# Altium schematic sheet Power-Sheet-1.SchDoc (part 2 of 3)
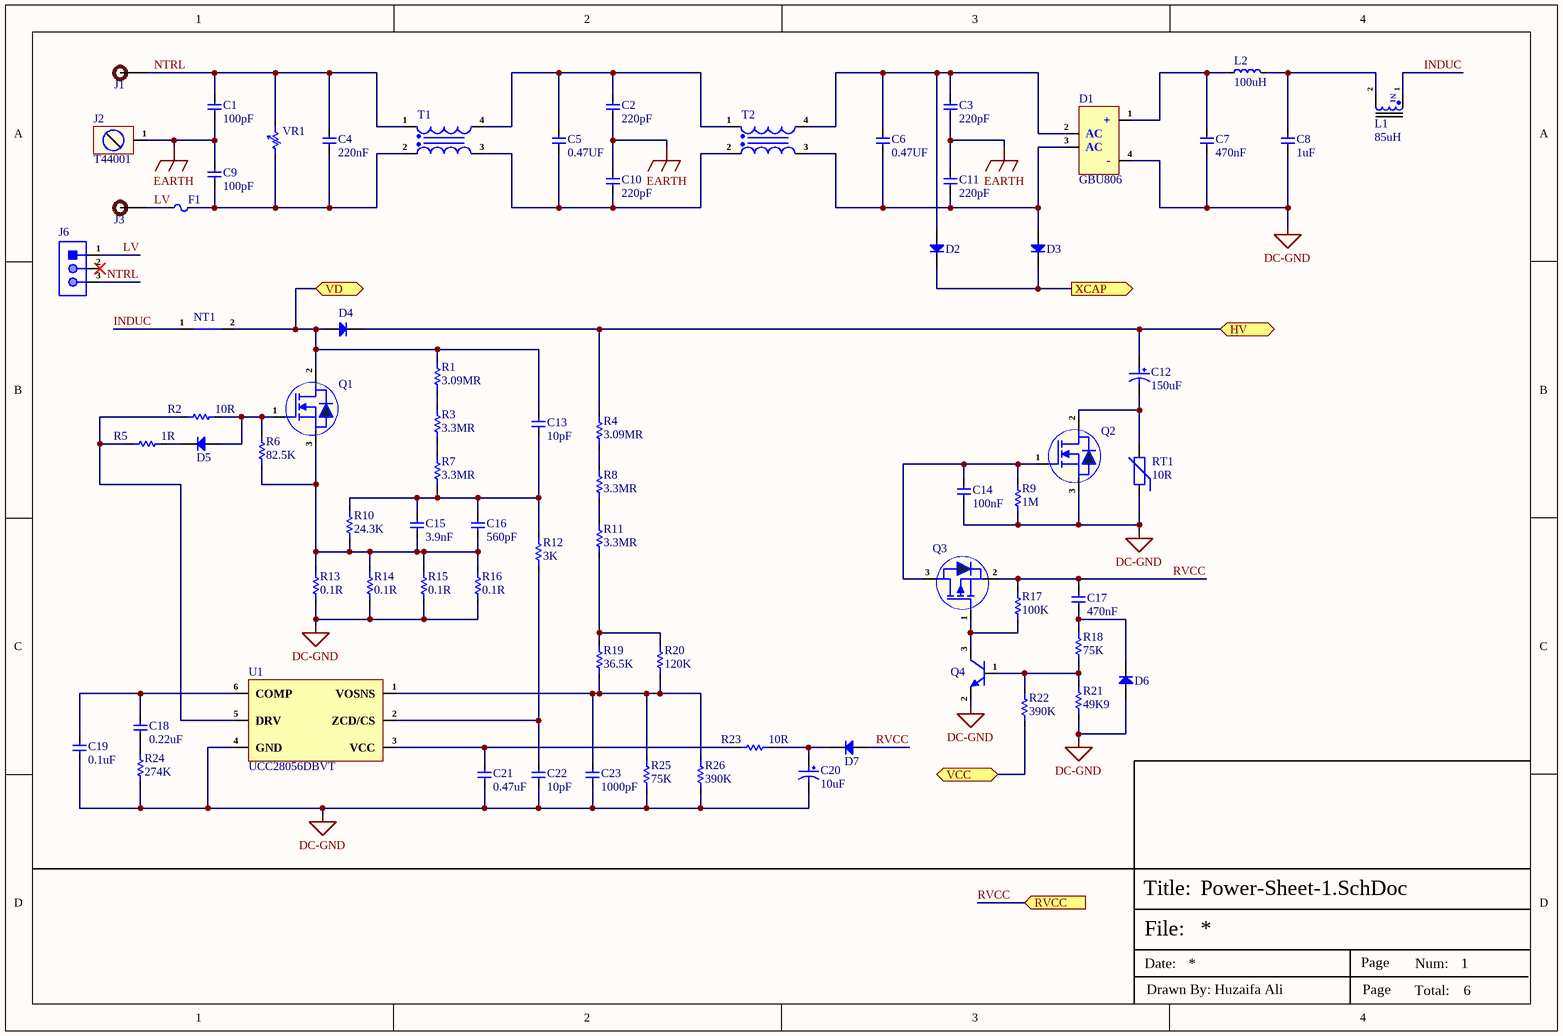
[diagram p1: Power-Sheet-1.SchDoc]
## Library data of the parts
C1 C9 = DE1B3RA101KN4AN01F: CAP CER 100PF 250V RADIAL; Manufacturer: Murata; Item Type: Capacitors; Material: 4241ConductorMaterial; Supplier: Mouser; LCSC Part Number: C3285641; Manufacturer Part Number: DE1B3RA101KN4AN01F; RoHS: Yes; Stock: 583; Pricing: 1=0.3, 10=0.147, 50=0.147, 100=0.123, 1000=0.089, 10000=0.061 (USD); Height: 9mm; ComponentLink1URL: https://search.murata.co.jp/Ceramy/image/img/A01X/G101/ENG/DE1_RA_N01F_E.pdf?src-supplier=Digikey; ComponentLink1Description: https://search.murata.co.jp/Ceramy/image/img/A01X/G101/ENG/DE1_RA_N01F_E.pdf?src-supplier=Digikey
C2 C3 C10 C11 = DE1B3RA221KN4AN01F: CAP CER 220PF 250V RADIAL; Manufacturer: Murata; Item Type: Suppression Capacitor; Supplier: Mouser; LCSC Part Number: C1622503; Manufacturer Part Number: DE1B3RA221KN4AN01F; RoHS: Yes; Stock: 985; Pricing: 1=0.35, 10=0.168, 50=0.168, 100=0.141, 1000=0.107, 10000=0.069 (USD); ComponentLink1URL: https://search.murata.co.jp/Ceramy/image/img/A01X/G101/ENG/DE1_RA_N01F_E.pdf?src-supplier=Digikey; ComponentLink1Description: https://search.murata.co.jp/Ceramy/image/img/A01X/G101/ENG/DE1_RA_N01F_E.pdf?src-supplier=Digikey
C4 = X2P2224KN1B0130150080ES0: 220nF ±10% X2 275V Plugin,P=10mm Suppression Capacitors ROHS; Manufacturer: STE; Manufacturer Part Number: X2P2224KN1B0130150080ES0; Package: Plugin,P=10mm; LCSC Part Number: C286022; Item Type: Suppression Capacitor; ComponentLink1Description: LCSC; ComponentLink1URL: https://www.lcsc.com/product-detail/Suppression-Capacitors_STE-Songtian-Elec-X2P2224KN1B0130150080ES0_C286022.html
C5 C6 = R46KI347050M1K: CAP FILM 0.47UF 10% 560VDC RAD; Manufacturer: KEMET; Item Type: Capacitor; Lead Length: 25mm; Supplier: Mouser; LCSC Part Number: C696791; Manufacturer Part Number: R46KI347050M1K; RoHS: Yes; Stock: 2256; Pricing: 1=0.88, 10=0.633, 50=0.633, 100=0.493, 1000=0.421, 10000=0.322 (USD); Pins: 2NUMBER; ComponentLink1URL: http://components.arrow.com/part/dataview/47471301S8592209N7429?src-supplier=Arrow+Electronics; ComponentLink1Description: http://components.arrow.com/part/dataview/47471301S8592209N7429?src-supplier=Arrow+Electronics; ComponentLink2URL: http://datasheet.octopart.com/R46KI347050M1K-Kemet-datasheet-5313608.pdf?src-supplier=Mouser; ComponentLink2Description: http://datasheet.octopart.com/R46KI347050M1K-Kemet-datasheet-5313608.pdf?src-supplier=Mouser; ComponentLink3URL: https://datasheet.octopart.com/R46KI347050M1K-Kemet-datasheet-5313608.pdf?src-supplier=Element14; ComponentLink3Description: https://datasheet.octopart.com/R46KI347050M1K-Kemet-datasheet-5313608.pdf?src-supplier=Element14; ComponentLink4URL: http://datasheet.octopart.com/R46KI347050M1K-Kemet-datasheet-5313608.pdf?src-supplier=Newark; ComponentLink4Description: http://datasheet.octopart.com/R46KI347050M1K-Kemet-datasheet-5313608.pdf?src-supplier=Newark; ComponentLink5URL: http://datasheet.octopart.com/R46KI347050M1K-Kemet-datasheet-5313608.pdf?src-supplier=Distrelec; ComponentLink5Description: http://datasheet.octopart.com/R46KI347050M1K-Kemet-datasheet-5313608.pdf?src-supplier=Distrelec; ComponentLink6URL: https://api.kemet.com/component-edge/download/datasheet/R46KI347050M1K.pdf?src-supplier=Digikey; ComponentLink6Description: https://api.kemet.com/component-edge/download/datasheet/R46KI347050M1K.pdf?src-supplier=Digikey; ComponentLink7URL: http://datasheet.octopart.com/R46KI347050M1K-Kemet-datasheet-5313608.pdf?src-supplier=Avnet; ComponentLink7Description: http://datasheet.octopart.com/R46KI347050M1K-Kemet-datasheet-5313608.pdf?src-supplier=Avnet; ComponentLink8URL: http://datasheet.octopart.com/R46KI347050M1K-Kemet-datasheet-5313608.pdf?src-supplier=Farnell; ComponentLink8Description: http://datasheet.octopart.com/R46KI347050M1K-Kemet-datasheet-5313608.pdf?src-supplier=Farnell; ComponentLink9URL: http://datasheet.octopart.com/R46KI347050M1K-Kemet-datasheet-5313608.pdf?src-supplier=Arrow+Electronics; ComponentLink9Description: http://datasheet.octopart.com/R46KI347050M1K-Kemet-datasheet-5313608.pdf?src-supplier=Arrow+Electronics; ComponentLink10URL: http://datasheet.octopart.com/R46KI347050M1K-Kemet-datasheet-5313608.pdf?src-supplier=Onlinecomponents.com; ComponentLink10Description: http://datasheet.octopart.com/R46KI347050M1K-Kemet-datasheet-5313608.pdf?src-supplier=Onlinecomponents.com; ComponentLink11URL: http://datasheet.octopart.com/R46KI347050M1K-Kemet-datasheet-5313608.pdf?src-supplier=Verical; ComponentLink11Description: http://datasheet.octopart.com/R46KI347050M1K-Kemet-datasheet-5313608.pdf?src-supplier=Verical; ComponentLink12URL: http://datasheet.octopart.com/R46KI347050M1K-Kemet-datasheet-5313608.pdf?src-supplier=LCSC; ComponentLink12Description: http://datasheet.octopart.com/R46KI347050M1K-Kemet-datasheet-5313608.pdf?src-supplier=LCSC; ComponentLink13URL: https://datasheet.octopart.com/R46KI347050M1K-Kemet-datasheet-67199277.pdf?src-supplier=TME; ComponentLink13Description: https://datasheet.octopart.com/R46KI347050M1K-Kemet-datasheet-67199277.pdf?src-supplier=TME; ComponentLink14URL: http://datasheet.octopart.com/R46KI347050M1K-Kemet-datasheet-5313608.pdf?src-supplier=Electro+Sonic; ComponentLink14Description: http://datasheet.octopart.com/R46KI347050M1K-Kemet-datasheet-5313608.pdf?src-supplier=Electro+Sonic
C7 = 450MPK474J: CAP FILM 0.47UF 5% 450VDC RADIAL; Manufacturer: Rubycon; Item Type: Film Capacitors; Dielectric Material: Polypropylene; Voltage Rating (DC): 450V; Supplier: Digikey; LCSC Part Number: C2798220; Manufacturer Part Number: 450MPK474J; RoHS: Yes; Stock: 4083; Pricing: 1=0.84, 10=0.605, 100=0.4311, 4000=0.26942, 8000=0.25962, 12000=0.25531 (USD); Mounting Technology: Through Hole; Case/Package: Radial; Min Operating Temperature: -40°C; Max Operating Temperature: 105°C; Package Quantity: 1; Value: 470nF; Tolerance: 5%; Packaging: Cut Tape; Termination: PC Pins; Series: MPK; Length: 0.709inch; Width: 0.256inch; Height - Seated (Max): 0.433inch; Lead Pitch: 0.591inch; RoHS Compliant: Yes; ComponentLink1URL: https://datasheet.ciiva.com/6281/e-mpk-6281321.pdf?src-supplier=Digikey; ComponentLink1Description: https://datasheet.ciiva.com/6281/e-mpk-6281321.pdf?src-supplier=Digikey; ComponentLink2URL: https://datasheet.ciiva.com/15021/e-mpk-15021932.pdf?src-supplier=Digikey; ComponentLink2Description: https://datasheet.ciiva.com/15021/e-mpk-15021932.pdf?src-supplier=Digikey
C8 = MPP105J2W10KN22605: 1uF -40℃~+105℃ ±5% 450V Plugin,P=10mm Polypropylene Film Capacitors (CBB) ROHS; Manufacturer: KNSCHA; Supplier: LCSC; LCSC Part Number: C2686214; Manufacturer Part Number: MPP105J2W10KN22605; RoHS: No; Item Type: Capacitor
C12 = KN151M45025*30A: 20% 900mA@120Hz 10mm 450V 150uF Plugin,D25xL30mm Horn-Type Electrolytic Capacitors ROHS; Manufacturer: KFSON; Manufacturer Part Number: KN151M45025*30A; Package: Plugin,D25xL30mm; LCSC Part Number: C513373; Item Type: Capacitor; ComponentLink1Description: LCSC; ComponentLink1URL: https://www.lcsc.com/product-detail/Horn-Type-Electrolytic-Capacitors_KFSON-KN151M45025-30A_C513373.html
C13 = CC1206JKNPOCBN100: CAP CER 10PF 1KV C0G/NPO 1206; Manufacturer: Yageo; Item Type: Capacitor; Supplier: Future Electronics; LCSC Part Number: C107172; Manufacturer Part Number: CC1206JKNPOCBN100; RoHS: Yes; Stock: 9000; Pricing: 3000=0.0222, 9000=0.0214, 15000=0.021, 60000=0.0201, 90000=0.0194 (USD); ComponentLink1URL: https://datasheet.ciiva.com/11494/hv-11494856.pdf?src-supplier=Avnet; ComponentLink1Description: https://datasheet.ciiva.com/11494/hv-11494856.pdf?src-supplier=Avnet
C14 = CC0603KRX5R9BB104: CAP CER 0.1UF 50V X5R 0603; Manufacturer: Yageo; Tolerance: 10%; Item Type: Capacitor; Supplier 1: Digi-Key; Manufacturer Part Number: CC0603KRX5R9BB104; RoHS: Yes; Category: Ceramic Capacitors; Stock 1: 152253; Pricing 1: 1=0.10000, 10=0.05200, 50=0.02820, 100=0.02310, 500=0.01648, 1000=0.01294 (USD); Mount: Surface Mount; Case/Package: 0603; Case Code (Imperial): 0603; Case Code (Metric): 1608; Weight: 7.1E-05oz; Min Operating Temperature: -55°C; Max Operating Temperature: 85°C; Capacitance: 100nF; Packaging: Tape and Reel; Voltage Rating: 50V; Dielectric: X5R; Termination: SMD/SMT; Voltage Rating (DC): 50V; Package Quantity: 4000; Length: 0.063inch; Width: 0.031inch; Thickness: 0.035inch; Lead Free: Lead Free; Halogen Free: Halogen Free; ComponentLink1URL: http://www.mouser.com/ds/2/447/Yageo_UPY-GP_NP0_16V-to-50V_9-358835.pdf?src-supplier=Mouser; ComponentLink1Description: http://www.mouser.com/ds/2/447/Yageo_UPY-GP_NP0_16V-to-50V_9-358835.pdf?src-supplier=Mouser; ComponentLink2URL: https://www.yageo.com/upload/media/product/productsearch/datasheet/mlcc/UPY-GPHC_X5R_4V-to-50V_26.pdf?src-supplier=Digi-Key; ComponentLink2Description: https://www.yageo.com/upload/media/product/productsearch/datasheet/mlcc/UPY-GPHC_X5R_4V-to-50V_26.pdf?src-supplier=Digi-Key; ComponentLink3URL: http://www.yageo.com/exep/pages/download/literatures/ProductSelectionGuide%202014_Final_2.pdf?src-supplier=Digi-Key; ComponentLink3Description: http://www.yageo.com/exep/pages/download/literatures/ProductSelectionGuide%202014_Final_2.pdf?src-supplier=Digi-Key; Supplier Part Number 1: 311-4046-1-ND; LCSC Part Number: C110022
C15 = CC0603KRX7R8BB392: CAP CER 3900PF 25V X7R 0603; Manufacturer: Yageo; Item Type: Capacitor; Material: 4241ConductorMaterial; Tolerance: 10%; Supplier: Digikey; LCSC Part Number: C519424; Manufacturer Part Number: CC0603KRX7R8BB392; RoHS: Yes; Stock: 46115; Pricing: 1=0.1, 10=0.061, 50=0.035, 100=0.0271, 500=0.02036, 1000=0.016 (USD); Mounting Technology: Surface Mount; Case/Package: 0603; Case Code (Imperial): 0603; Case Code (Metric): 1608; Weight: 7.1E-05oz; Min Operating Temperature: -55°C; Max Operating Temperature: 125°C; Value: 3.9nF; Voltage Rating (DC): 25V; Packaging: Tape and Reel; Dielectric: X7R; Termination: SMD/SMT; Voltage Rating: 25V; Series: CC; Length: 0.063inch; Width: 0.031inch; Height: 900um; Thickness: 0.035inch; Lead Free: Lead Free; Halogen Free: Halogen Free; ComponentLink1URL: https://datasheet.ciiva.com/13207/upy-gphc-x7r-6-3v-to-50v-8-12304-13207771.pdf?src-supplier=Mouser; ComponentLink1Description: https://datasheet.ciiva.com/13207/upy-gphc-x7r-6-3v-to-50v-8-12304-13207771.pdf?src-supplier=Mouser
C16 = 06035A561JAT2A: CAP CER 560PF 50V C0G/NP0 0603; Manufacturer: Kyocera AVX; Item Type: Capacitor; Supplier: Future Electronics; LCSC Part Number: C597173; Manufacturer Part Number: 06035A561JAT2A; RoHS: Yes; Stock: 180000; Pricing: 4000=0.0172, 16000=0.0165, 40000=0.0091, 60000=0.0158, 100000=0.0088, 120000=0.0155, 160000=0.0083, 300000=0.0148 (USD); ComponentLink1URL: https://datasheet.ciiva.com/27051/1032160-27051276.pdf?src-supplier=Jameco; ComponentLink1Description: https://datasheet.ciiva.com/27051/1032160-27051276.pdf?src-supplier=Jameco; ComponentLink2URL: https://datasheet.ciiva.com/16286/ccog-16286446.pdf?src-supplier=Future+Electronics; ComponentLink2Description: https://datasheet.ciiva.com/16286/ccog-16286446.pdf?src-supplier=Future+Electronics; ComponentLink3URL: https://datasheet.ciiva.com/150/ccog-150647.pdf?src-supplier=Digikey; ComponentLink3Description: https://datasheet.ciiva.com/150/ccog-150647.pdf?src-supplier=Digikey; ComponentLink4URL: https://datasheet.ciiva.com/150/ccog-150648.pdf?src-supplier=Digikey; ComponentLink4Description: https://datasheet.ciiva.com/150/ccog-150648.pdf?src-supplier=Digikey; ComponentLink5URL: https://datasheet.ciiva.com/150/ccog-150649.pdf?src-supplier=Digikey; ComponentLink5Description: https://datasheet.ciiva.com/150/ccog-150649.pdf?src-supplier=Digikey; ComponentLink6URL: https://datasheet.ciiva.com/2987/ccog-2987809.pdf?src-supplier=Avnet; ComponentLink6Description: https://datasheet.ciiva.com/2987/ccog-2987809.pdf?src-supplier=Avnet; ComponentLink7URL: https://datasheet.ciiva.com/2987/ccog-2987810.pdf?src-supplier=Avnet; ComponentLink7Description: https://datasheet.ciiva.com/2987/ccog-2987810.pdf?src-supplier=Avnet; ComponentLink8URL: https://datasheet.ciiva.com/5423/ccog-5423589.pdf?src-supplier=Mouser; ComponentLink8Description: https://datasheet.ciiva.com/5423/ccog-5423589.pdf?src-supplier=Mouser; ComponentLink9URL: https://datasheet.ciiva.com/14598/70001039-14598549.pdf?src-supplier=Allied+Electronics; ComponentLink9Description: https://datasheet.ciiva.com/14598/70001039-14598549.pdf?src-supplier=Allied+Electronics; ComponentLink10URL: https://datasheet.ciiva.com/1124/425357-1124836.pdf?src-supplier=Element14; ComponentLink10Description: https://datasheet.ciiva.com/1124/425357-1124836.pdf?src-supplier=Element14; ComponentLink11URL: https://datasheet.ciiva.com/1124/425357-1124837.pdf?src-supplier=Element14; ComponentLink11Description: https://datasheet.ciiva.com/1124/425357-1124837.pdf?src-supplier=Element14
C17 = 12063C474KAT2A: CAP CER 0.47UF 25V X7R 1206; Manufacturer: Kyocera AVX; Item Type: Capacitor; Supplier: Future Electronics; LCSC Part Number: C5128353; Manufacturer Part Number: 12063C474KAT2A; RoHS: Yes; Stock: 38000; Pricing: 2000=0.0614, 6000=0.0591, 10000=0.0566, 20000=0.0567, 40000=0.0554, 80000=0.053 (USD); ComponentLink1URL: https://datasheet.ciiva.com/11788/0900766b80dc2409-11788602.pdf?src-supplier=Rs; ComponentLink1Description: https://datasheet.ciiva.com/11788/0900766b80dc2409-11788602.pdf?src-supplier=Rs; ComponentLink2URL: https://datasheet.ciiva.com/19476/2014158-19476160.pdf?src-supplier=Jameco; ComponentLink2Description: https://datasheet.ciiva.com/19476/2014158-19476160.pdf?src-supplier=Jameco; ComponentLink3URL: https://datasheet.ciiva.com/14601/70001075-14601957.pdf?src-supplier=Allied+Electronics; ComponentLink3Description: https://datasheet.ciiva.com/14601/70001075-14601957.pdf?src-supplier=Allied+Electronics; ComponentLink4URL: https://datasheet.ciiva.com/28546/683218-28546839.pdf?src-supplier=Element14; ComponentLink4Description: https://datasheet.ciiva.com/28546/683218-28546839.pdf?src-supplier=Element14; ComponentLink5URL: https://datasheet.ciiva.com/7833/84526-7833365.pdf?src-supplier=Element14; ComponentLink5Description: https://datasheet.ciiva.com/7833/84526-7833365.pdf?src-supplier=Element14; ComponentLink6URL: https://datasheet.ciiva.com/16291/cx7r-16291039.pdf?src-supplier=Future+Electronics; ComponentLink6Description: https://datasheet.ciiva.com/16291/cx7r-16291039.pdf?src-supplier=Future+Electronics; ComponentLink7URL: https://datasheet.ciiva.com/152/cx7r-152592.pdf?src-supplier=Digikey; ComponentLink7Description: https://datasheet.ciiva.com/152/cx7r-152592.pdf?src-supplier=Digikey; ComponentLink8URL: https://datasheet.ciiva.com/152/cx7r-152593.pdf?src-supplier=Digikey; ComponentLink8Description: https://datasheet.ciiva.com/152/cx7r-152593.pdf?src-supplier=Digikey; ComponentLink9URL: https://datasheet.ciiva.com/152/cx7r-152594.pdf?src-supplier=Digikey; ComponentLink9Description: https://datasheet.ciiva.com/152/cx7r-152594.pdf?src-supplier=Digikey
C18 = CC0603KRX7R7BB224: CAP CER 0.22UF 16V X7R 0603; Manufacturer: Yageo; Item Type: Capacitor; Material: 4241ConductorMaterial; Supplier: Digikey; Supplier Part Number: 311-1426-1-ND; Manufacturer Part Number: CC0603KRX7R7BB224; RoHS: Yes; Stock: 45192; Pricing: 1=0.1, 10=0.058, 50=0.0334, 100=0.0258, 500=0.01944, 1000=0.01528 (USD); Voltage Rating (DC): 16V; Lead Free: 5697LeadFree; Halogen Free: 5694HalogenFree; ComponentLink1URL: https://datasheet.ciiva.com/11788/0900766b80d84f1d-11788400.pdf?src-supplier=Rs; ComponentLink1Description: https://datasheet.ciiva.com/11788/0900766b80d84f1d-11788400.pdf?src-supplier=Rs; ComponentLink2URL: https://datasheet.ciiva.com/176/mlccorderingcode-176606.pdf?src-supplier=Digikey; ComponentLink2Description: https://datasheet.ciiva.com/176/mlccorderingcode-176606.pdf?src-supplier=Digikey; ComponentLink3URL: https://datasheet.ciiva.com/176/mlccorderingcode-176607.pdf?src-supplier=Digikey; ComponentLink3Description: https://datasheet.ciiva.com/176/mlccorderingcode-176607.pdf?src-supplier=Digikey; ComponentLink4URL: https://datasheet.ciiva.com/176/mlccorderingcode-176608.pdf?src-supplier=Digikey; ComponentLink4Description: https://datasheet.ciiva.com/176/mlccorderingcode-176608.pdf?src-supplier=Digikey
C19 = CL10B104KB8NNNL: CAP CER 0.1UF 50V X7R 0603; Manufacturer: Samsung; Capacitance: 100nF; Tolerance: 10%; Item Type: Capacitor; Supplier 1: Digi-Key; Manufacturer Part Number: CL10B104KB8NNNL; Stock 1: 3731229; Pricing 1: 1=0.1, 10=0.03, 50=0.0164, 100=0.0134, 500=0.00958, 1000=0.00753, 2500=0.00684, 5000=0.0063 (USD); Mount: Surface Mount; Case/Package: 0603; Min Operating Temperature: -55°C; Max Operating Temperature: 125°C; Dielectric: X7R; Packaging: Tape and Reel; Package Quantity: 15000; Voltage Rating: 50V; Voltage Rating (DC): 50V; Series: CL; Construction: Flat; Length: 1.6mm; Width: 0.031inch; Height: 0.8mm; Thickness: 0.035inch; Depth: 0.8mm; Radiation Hardening: No; RoHS Compliant: Yes; ComponentLink1URL: https://www.verical.com/server-webapp/html/getDatasheet?partID=357523&src-supplier=Verical; ComponentLink1Description: https://www.verical.com/server-webapp/html/getDatasheet?partID=357523&src-supplier=Verical; ComponentLink2URL: https://media.digikey.com/pdf/Data%20Sheets/Samsung%20PDFs/CL_Series_MLCC_ds.pdf?src-supplier=Digi-Key; ComponentLink2Description: https://media.digikey.com/pdf/Data%20Sheets/Samsung%20PDFs/CL_Series_MLCC_ds.pdf?src-supplier=Digi-Key; Supplier Part Number 1: 1276-CL10B104KB8NNNLCT-ND; LCSC Part Number: C913912
C20 = ERM1HM100D11OT: 10uF 50V ±20% 90mA@100kHz Plugin,D5xL11mm Aluminum Electrolytic Capacitors - Leaded ROHS; Manufacturer: AISHI; Supplier: Future Electronics; LCSC Part Number: C106599; Manufacturer Part Number: ERM1HM100D11OT; RoHS: No; Pricing: 1000=0.0178, 4000=0.017, 15000=0.0163, 40000=0.0158, 100000=0.015 (USD); Item Type: Capacitor
C21 = CC1206KKX7R9BB474: CAP CER 0.47UF 50V X7R 1206; Manufacturer: Yageo; Item Type: Capacitor; Material: 4241ConductorMaterial; Supplier: Future Electronics; LCSC Part Number: C277483; Manufacturer Part Number: CC1206KKX7R9BB474; RoHS: Yes; Stock: 36000; Pricing: 3000=0.0393, 9000=0.0378, 15000=0.0371, 30000=0.0362, 60000=0.0349 (USD); ComponentLink1URL: https://datasheet.ciiva.com/13210/upy-gp-np0-16v-to-50v-8-13210236.pdf?src-supplier=Mouser; ComponentLink1Description: https://datasheet.ciiva.com/13210/upy-gp-np0-16v-to-50v-8-13210236.pdf?src-supplier=Mouser; ComponentLink2URL: https://datasheet.ciiva.com/181/mlccorderingcode-181013.pdf?src-supplier=Digikey; ComponentLink2Description: https://datasheet.ciiva.com/181/mlccorderingcode-181013.pdf?src-supplier=Digikey; ComponentLink3URL: https://datasheet.ciiva.com/181/mlccorderingcode-181014.pdf?src-supplier=Digikey; ComponentLink3Description: https://datasheet.ciiva.com/181/mlccorderingcode-181014.pdf?src-supplier=Digikey; ComponentLink4URL: https://datasheet.ciiva.com/181/mlccorderingcode-181015.pdf?src-supplier=Digikey; ComponentLink4Description: https://datasheet.ciiva.com/181/mlccorderingcode-181015.pdf?src-supplier=Digikey
C22 = C0603C100K5RACAUTO: CAP CER 10PF 50V X7R 0603; Manufacturer: KEMET; Item Type: Capacitor; Material: 4241ConductorMaterial; Temperature Coefficient: 30ppm/°C; Supplier: Mouser; LCSC Part Number: C2170082; Manufacturer Part Number: C0603C100K5RACAUTO; RoHS: Yes; Stock: 11331; Pricing: 1=0.25, 10=0.116, 50=0.116, 100=0.07, 1000=0.061, 10000=0.047 (USD); Height: 870um; ComponentLink1URL: http://www.farnell.com/datasheets/2750555.pdf?src-supplier=Farnell; ComponentLink1Description: http://www.farnell.com/datasheets/2750555.pdf?src-supplier=Farnell; ComponentLink2URL: https://api.kemet.com/component-edge/download/datasheet/C0603C100K5RACAUTO.pdf?src-supplier=Digikey; ComponentLink2Description: https://api.kemet.com/component-edge/download/datasheet/C0603C100K5RACAUTO.pdf?src-supplier=Digikey; ComponentLink3URL: http://www.farnell.com/datasheets/2750555.pdf?src-supplier=Element14; ComponentLink3Description: http://www.farnell.com/datasheets/2750555.pdf?src-supplier=Element14; ComponentLink4URL: https://datasheet.octopart.com/C0603C100K5RACAUTO-KEMET-datasheet-86780146.pdf?src-supplier=Newark; ComponentLink4Description: https://datasheet.octopart.com/C0603C100K5RACAUTO-KEMET-datasheet-86780146.pdf?src-supplier=Newark; ComponentLink5URL: http://www.farnell.com/datasheets/2750555.pdf?src-supplier=Newark; ComponentLink5Description: http://www.farnell.com/datasheets/2750555.pdf?src-supplier=Newark; ComponentLink6URL: https://datasheet.octopart.com/C0603C100K5RACAUTO-KEMET-datasheet-140424581.pdf?src-supplier=TME; ComponentLink6Description: https://datasheet.octopart.com/C0603C100K5RACAUTO-KEMET-datasheet-140424581.pdf?src-supplier=TME
C23 = 06031C102KAT2A: CAP CER 1000PF 100V X7R 0603; Manufacturer: Kyocera AVX; Item Type: Capacitor; Supplier: Avnet; LCSC Part Number: C2167292; Manufacturer Part Number: 06031C102KAT2A; RoHS: Yes; Stock: 656000; Pricing: 4000=0.0086, 8000=0.0084, 16000=0.0082, 24000=0.008, 32000=0.0079 (USD); Lead Free: 5697LeadFree; ComponentLink1URL: https://datasheet.ciiva.com/5422/cx7r-218113-5422905.pdf?src-supplier=Mouser; ComponentLink1Description: https://datasheet.ciiva.com/5422/cx7r-218113-5422905.pdf?src-supplier=Mouser; ComponentLink2URL: https://datasheet.ciiva.com/11499/cx7r-11499669.pdf?src-supplier=Avnet; ComponentLink2Description: https://datasheet.ciiva.com/11499/cx7r-11499669.pdf?src-supplier=Avnet; ComponentLink3URL: https://datasheet.ciiva.com/2987/cx7r-2987733.pdf?src-supplier=Avnet; ComponentLink3Description: https://datasheet.ciiva.com/2987/cx7r-2987733.pdf?src-supplier=Avnet; ComponentLink4URL: https://datasheet.ciiva.com/150/cx7r-150395.pdf?src-supplier=Digikey; ComponentLink4Description: https://datasheet.ciiva.com/150/cx7r-150395.pdf?src-supplier=Digikey; ComponentLink5URL: https://datasheet.ciiva.com/150/cx7r-150396.pdf?src-supplier=Digikey; ComponentLink5Description: https://datasheet.ciiva.com/150/cx7r-150396.pdf?src-supplier=Digikey; ComponentLink6URL: https://datasheet.ciiva.com/150/cx7r-150397.pdf?src-supplier=Digikey; ComponentLink6Description: https://datasheet.ciiva.com/150/cx7r-150397.pdf?src-supplier=Digikey; ComponentLink7URL: https://datasheet.ciiva.com/1124/1679506-1124198.pdf?src-supplier=Element14; ComponentLink7Description: https://datasheet.ciiva.com/1124/1679506-1124198.pdf?src-supplier=Element14; ComponentLink8URL: https://datasheet.ciiva.com/22693/1679506-22693579.pdf?src-supplier=Element14; ComponentLink8Description: https://datasheet.ciiva.com/22693/1679506-22693579.pdf?src-supplier=Element14; ComponentLink9URL: https://datasheet.ciiva.com/7855/1679506-7855033.pdf?src-supplier=Element14; ComponentLink9Description: https://datasheet.ciiva.com/7855/1679506-7855033.pdf?src-supplier=Element14; ComponentLink10URL: https://datasheet.ciiva.com/7855/84526-7855189.pdf?src-supplier=Element14; ComponentLink10Description: https://datasheet.ciiva.com/7855/84526-7855189.pdf?src-supplier=Element14; ComponentLink11URL: https://datasheet.ciiva.com/16289/cx7r-16289400.pdf?src-supplier=Future+Electronics; ComponentLink11Description: https://datasheet.ciiva.com/16289/cx7r-16289400.pdf?src-supplier=Future+Electronics; ComponentLink12URL: https://datasheet.ciiva.com/14594/70001075-14594623.pdf?src-supplier=Allied+Electronics; ComponentLink12Description: https://datasheet.ciiva.com/14594/70001075-14594623.pdf?src-supplier=Allied+Electronics; ComponentLink13URL: https://datasheet.ciiva.com/14600/70001075-14600988.pdf?src-supplier=Allied+Electronics; ComponentLink13Description: https://datasheet.ciiva.com/14600/70001075-14600988.pdf?src-supplier=Allied+Electronics
D1 = GBU806: BRIDGE RECT 1PHASE 600V 8A GBU; Manufacturer: Diodes; Item Type: Diode; Supplier: Future Electronics; LCSC Part Number: C150753; Manufacturer Part Number: GBU806; RoHS: Yes; Stock: 174414; Pricing: 20=0.565, 100=0.54, 500=0.51, 1000=0.5, 3000=0.465 (USD); ComponentLink1URL: https://datasheet.ciiva.com/27052/1540404-27052400.pdf?src-supplier=Jameco; ComponentLink1Description: https://datasheet.ciiva.com/27052/1540404-27052400.pdf?src-supplier=Jameco; ComponentLink2URL: https://datasheet.ciiva.com/16206/ds21227-16206956.pdf?src-supplier=Future+Electronics; ComponentLink2Description: https://datasheet.ciiva.com/16206/ds21227-16206956.pdf?src-supplier=Future+Electronics; ComponentLink3URL: https://datasheet.ciiva.com/15145/getdatasheetpartid-157294-15145339.pdf?src-supplier=Verical; ComponentLink3Description: https://datasheet.ciiva.com/15145/getdatasheetpartid-157294-15145339.pdf?src-supplier=Verical; ComponentLink4URL: https://datasheet.ciiva.com/885/ds21227-885908.pdf?src-supplier=Digikey; ComponentLink4Description: https://datasheet.ciiva.com/885/ds21227-885908.pdf?src-supplier=Digikey; ComponentLink5URL: https://datasheet.ciiva.com/11195/ds21227-11195657.pdf?src-supplier=Avnet; ComponentLink5Description: https://datasheet.ciiva.com/11195/ds21227-11195657.pdf?src-supplier=Avnet
D2 D3 = MURA160T3G: DIODE GEN PURP 600V 1A SMA; Manufacturer: ON Semiconductor; Forward Current: 2A; Max Reverse Current: 5uA; Max Surge Current: 30A; Forward Voltage: 1.25V; Recovery Time: 75ns; Polarity: Standard; Supplier: Future Electronics; LCSC Part Number: C50432; Manufacturer Part Number: MURA160T3G; RoHS: Yes; Item Type: Diode; Stock: 190000; Pricing: 5000=0.109, 10000=0.106, 15000=0.104, 20000=0.103, 25000=0.0996 (USD); Case/Package: SMA; Pins: 2; Min Operating Temperature: -65°C; Max Operating Temperature: 175°C; Package Quantity: 1; Packaging: Tape and Reel; Average Rectified Current: 2A; Reverse Recovery Time: 75ns; Max Repetitive Reverse Voltage (Vrrm): 600V; Peak Non-Repetitive Surge Current: 30A; Max Forward Surge Current (Ifsm): 30A; Voltage Rating (DC): 600V; Current Rating: 2A; Output Current: 1A; Max Reverse Voltage (DC): 600V; Reverse Voltage: 600V; Series: -; Reverse Recovery Time-Max: 75ns; Length: 4.32mm; Width: 2.6mm; Height: 2mm; Radiation Hardening: No; Reach SVHC Compliant: No; Lead Free: Lead Free; Halogen Free: Halogen Free; RoHS Compliant: Yes; ComponentLink1URL: https://datasheet.ciiva.com/8293/mura160t3-d-8293035.pdf?src-supplier=Avnet; ComponentLink1Description: https://datasheet.ciiva.com/8293/mura160t3-d-8293035.pdf?src-supplier=Avnet; ComponentLink2URL: https://datasheet.ciiva.com/27056/2015775-27056224.pdf?src-supplier=Jameco; ComponentLink2Description: https://datasheet.ciiva.com/27056/2015775-27056224.pdf?src-supplier=Jameco; ComponentLink3URL: https://datasheet.ciiva.com/16395/mura160t3-d-16395990.pdf?src-supplier=Future+Electronics; ComponentLink3Description: https://datasheet.ciiva.com/16395/mura160t3-d-16395990.pdf?src-supplier=Future+Electronics
D4 = STTH8L06FP: DIODE GEN PURP 600V 8A TO220FPAC; Manufacturer: STMicroelectronics; Supplier: Mouser; LCSC Part Number: C77956; Manufacturer Part Number: STTH8L06FP; RoHS: Yes; Item Type: Diode; Stock: 2675; Pricing: 1=0.8, 10=0.793, 50=0.793, 100=0.793, 1000=0.673, 10000=0.377 (USD); ComponentLink1URL: https://datasheet.ciiva.com/4455/cd00002721-110256-4455363.pdf?src-supplier=Mouser; ComponentLink1Description: https://datasheet.ciiva.com/4455/cd00002721-110256-4455363.pdf?src-supplier=Mouser; ComponentLink2URL: https://datasheet.ciiva.com/7964/1522573-7964086.pdf?src-supplier=Element14; ComponentLink2Description: https://datasheet.ciiva.com/7964/1522573-7964086.pdf?src-supplier=Element14; ComponentLink3URL: https://datasheet.ciiva.com/917/cd00002721-917751.pdf?src-supplier=Digikey; ComponentLink3Description: https://datasheet.ciiva.com/917/cd00002721-917751.pdf?src-supplier=Digikey; ComponentLink4URL: https://datasheet.ciiva.com/14169/cd00002721-14169005.pdf?src-supplier=Distrelec; ComponentLink4Description: https://datasheet.ciiva.com/14169/cd00002721-14169005.pdf?src-supplier=Distrelec
D5 D6 = MMDL914-TP: 100V 1V@10mA 4ns 200mA SOD-323 Switching Diodes ROHS; Manufacturer: MCC; Item Type: Diode; Supplier: Digikey; LCSC Part Number: C668970; Manufacturer Part Number: MMDL914-TP; RoHS: Yes; Stock: 172971; Pricing: 1=0.15, 10=0.108, 100=0.0585, 500=0.04594, 1000=0.03191 (USD); ComponentLink1URL: https://datasheet.ciiva.com/6367/mmdl914sod-323-6367364.pdf?src-supplier=Digikey; ComponentLink1Description: https://datasheet.ciiva.com/6367/mmdl914sod-323-6367364.pdf?src-supplier=Digikey; ComponentLink2URL: https://datasheet.ciiva.com/24097/mmdl914sod-323-24097719.pdf?src-supplier=Mouser; ComponentLink2Description: https://datasheet.ciiva.com/24097/mmdl914sod-323-24097719.pdf?src-supplier=Mouser; ComponentLink3URL: https://datasheet.ciiva.com/6367/mmdl914sod-323-6367366.pdf?src-supplier=Digikey; ComponentLink3Description: https://datasheet.ciiva.com/6367/mmdl914sod-323-6367366.pdf?src-supplier=Digikey; ComponentLink4URL: https://datasheet.ciiva.com/6367/mmdl914sod-323-6367368.pdf?src-supplier=Digikey; ComponentLink4Description: https://datasheet.ciiva.com/6367/mmdl914sod-323-6367368.pdf?src-supplier=Digikey
D7 = 1N4148WS-7-F: DIODE GEN PURP 75V 150MA SOD323; Manufacturer: Diodes; Forward Current: 300mA; Reverse Recovery Time: 4ns; Element Configuration: Single; Forward Voltage: 1.25V; Max Reverse Current: 1uA; Peak Non-Repetitive Surge Current: 2A; Power Dissipation: 200mW; Polarity: Standard; Capacitance: 2pF; Supplier 1: Mouser; Manufacturer Part Number: 1N4148WS-7-F; RoHS: Yes; Category: Rectifier Diodes; Pricing 1: 1=0.19000, 10=0.17500, 50=0.17500, 100=0.09600, 500=0.05900, 1000=0.04000, 3000=0.03000, 9000=0.02600, 10000=0.02600, 24000=0.02300, 45000=0.01900 (USD); Mount: Surface Mount; Number of Pins: 2; Weight: 0.000173oz; Contact Plating: Tin,Matte; Min Operating Temperature: -65°C; Max Operating Temperature: 150°C; Max Repetitive Reverse Voltage (Vrrm): 75V; Max Forward Surge Current (Ifsm): 2A; Max Surge Current: 2A; Packaging: Tape and Reel; Recovery Time: 4ns; Package Quantity: 3000; Average Rectified Current: 150mA; Voltage Rating (DC): 75V; Power Rating: 200mW; Current Rating: 150mA; Output Current: 150mA; Voltage: 75V; Max Reverse Voltage (DC): 75V; Series: -; Reverse Recovery Time-Max: 4ns; Length: 1.8mm; Width: 1.4mm; Height: 1mm; Radiation Hardening: No; REACH SVHC: No SVHC; Lead Free: Lead Free; RoHS Compliant: Yes; ComponentLink1URL: https://datasheet.ciiva.com/1179/ds30097-1179355.pdf?src-supplier=Element14; ComponentLink1Description: https://datasheet.ciiva.com/1179/ds30097-1179355.pdf?src-supplier=Element14; ComponentLink2URL: https://datasheet.ciiva.com/8300/ds30097-8300396.pdf?src-supplier=Avnet; ComponentLink2Description: https://datasheet.ciiva.com/8300/ds30097-8300396.pdf?src-supplier=Avnet; ComponentLink3URL: https://datasheet.ciiva.com/16199/ds30097-16199061.pdf?src-supplier=Future+Electronics; ComponentLink3Description: https://datasheet.ciiva.com/16199/ds30097-16199061.pdf?src-supplier=Future+Electronics; ComponentLink4URL: https://datasheet.ciiva.com/911/ds30097-911742.pdf?src-supplier=Digi-Key; ComponentLink4Description: https://datasheet.ciiva.com/911/ds30097-911742.pdf?src-supplier=Digi-Key; ComponentLink5URL: https://datasheet.ciiva.com/911/ds30097-911743.pdf?src-supplier=Digi-Key; ComponentLink5Description: https://datasheet.ciiva.com/911/ds30097-911743.pdf?src-supplier=Digi-Key; ComponentLink6URL: https://datasheet.ciiva.com/911/ds30097-911741.pdf?src-supplier=Digi-Key; ComponentLink6Description: https://datasheet.ciiva.com/911/ds30097-911741.pdf?src-supplier=Digi-Key; Supplier Part Number 1: 621-1N4148WS-F; LCSC Part Number: C60580; Item Type: Diode
F1 = 37215000001: FUSE BOARD MNT 5A 250VAC RADIAL; Manufacturer: Littelfuse Wickmann; Item Type: Fuses; Supplier: Digikey; LCSC Part Number: C142820; Manufacturer Part Number: 37215000001; RoHS: Yes; Stock: 2122; Pricing: 1=0.96, 5=0.928, 10=0.869, 50=0.7192, 100=0.5993, 250=0.58436, 500=0.49446 (USD); ComponentLink1URL: https://datasheet.ciiva.com/299/littelfuse-fuse-372-299190.pdf?src-supplier=Digikey; ComponentLink1Description: https://datasheet.ciiva.com/299/littelfuse-fuse-372-299190.pdf?src-supplier=Digikey; ComponentLink2URL: https://datasheet.ciiva.com/16298/littelfuse-fuse-372-16298798.pdf?src-supplier=Future+Electronics; ComponentLink2Description: https://datasheet.ciiva.com/16298/littelfuse-fuse-372-16298798.pdf?src-supplier=Future+Electronics
J2 = T44001: M4 Plugin PCB Welding Terminal ROHS; Manufacturer: XFCN; Manufacturer Part Number: T44001; Package: Plugin; ComponentLink1Description: LCSC; ComponentLink1URL: *
J6 = X5050WV-03-N2SN: 1x3P 3P 1 Tin 5.08mm 3 Brass 10A Direct Insert Plugin,P=5.08mm Wire To Board Connector ROHS; Manufacturer: XKB Connection; Manufacturer Part Number: X5050WV-03-N2SN; Package: Plugin,P=5.08mm; LCSC Part Number: C706974; Item Type: Wire To Board Connector; ComponentLink1Description: LCSC; ComponentLink1URL: https://www.lcsc.com/product-detail/Wire-To-Board-Connector_XKB-Connection-X5050WV-03-N2SN_C706974.html
L1 = FC-PFC1060-850M-B-L: 20A 85uH ±15% 10A Plugin,D=35mm Power Inductors ROHS; Manufacturer: FANGCHENG; Manufacturer Part Number: FC-PFC1060-850M-B-L; Package: Plugin,D=35mm; LCSC Part Number: C22461812; Item Type: Inductor; ComponentLink1Description: LCSC; ComponentLink1URL: https://www.lcsc.com/product-detail/Power-Inductors_FANGCHENG-FC-PFC1060-850M-B-L_C22461812.html
L2 = 7447021: FIXED IND 100UH 2A 80 MOHM TH; Manufacturer: Wurth Electronics; Item Type: Inductors; Supplier: Mouser; Supplier Part Number: 710-7447021; Manufacturer Part Number: 7447021; RoHS: Yes; Stock: 1392; Pricing: 1=1.93, 10=1.83, 50=1.71, 100=1.61, 1000=1.46, 10000=1.46 (USD); ComponentLink1URL: https://datasheet.ciiva.com/11796/0900766b804e2e89-11796539.pdf?src-supplier=Rs; ComponentLink1Description: https://datasheet.ciiva.com/11796/0900766b804e2e89-11796539.pdf?src-supplier=Rs; ComponentLink2URL: https://datasheet.ciiva.com/6693/7447021-6693538.pdf?src-supplier=Digikey; ComponentLink2Description: https://datasheet.ciiva.com/6693/7447021-6693538.pdf?src-supplier=Digikey; ComponentLink3URL: https://datasheet.ciiva.com/14101/pk7447021-data-de-14101850.pdf?src-supplier=Distrelec; ComponentLink3Description: https://datasheet.ciiva.com/14101/pk7447021-data-de-14101850.pdf?src-supplier=Distrelec; ComponentLink4URL: https://datasheet.ciiva.com/7695/7447021-7695676.pdf?src-supplier=Element14; ComponentLink4Description: https://datasheet.ciiva.com/7695/7447021-7695676.pdf?src-supplier=Element14; ComponentLink5URL: https://datasheet.ciiva.com/48691/001087627-da-01-ml-we-fi-funkentstoerdrossel-7447021-de-en-48691575.pdf?src-supplier=Conrad; ComponentLink5Description: https://datasheet.ciiva.com/48691/001087627-da-01-ml-we-fi-funkentstoerdrossel-7447021-de-en-48691575.pdf?src-supplier=Conrad
NT1 = Net Tie_SMD: Net Tie SMD; Manufacturer Part Number: Net Tie; Item Type: Net Tie Pad
Q1 = IPP60R099P7XKSA1: MOSFET N-CH 600V 31A TO220-3; Manufacturer: Infineon; Supplier: Mouser; LCSC Part Number: C672383; Manufacturer Part Number: IPP60R099P7XKSA1; RoHS: Yes; Item Type: MOSFET; Stock: 311; Pricing: 1=4.15, 10=3.48, 50=3.29, 100=2.82, 1000=2.14, 10000=2.02 (USD); ComponentLink1URL: https://www.infineon.com/dgdl/Infineon-IPP60R099P7-DS-v02_00-EN.pdf?fileId=5546d4625b10283a015b1979a00e4aaa&src-supplier=Digikey; ComponentLink1Description: https://www.infineon.com/dgdl/Infineon-IPP60R099P7-DS-v02_00-EN.pdf?fileId=5546d4625b10283a015b1979a00e4aaa&src-supplier=Digikey; ComponentLink2URL: https://datasheet.octopart.com/IPP60R099P7XKSA1-Infineon-datasheet-96921537.pdf?src-supplier=TME; ComponentLink2Description: https://datasheet.octopart.com/IPP60R099P7XKSA1-Infineon-datasheet-96921537.pdf?src-supplier=TME
Q2 = STB24NM60N-VB: 650V 190mΩ@10V 3.5V 1PCSNChannel TO-263 MOSFETs ROHS; Manufacturer: VBsemi Elec; Item Type: MOSFET; Manufacturer Part Number: STB24NM60N-VB; Package: TO-263; LCSC Part Number: C7569064; ComponentLink1Description: LCSC; ComponentLink1URL: https://www.lcsc.com/product-detail/MOSFETs_VBsemi-Elec-STB24NM60N-VB_C7569064.html
Q3 = SI2309CDS-T1-E3: MOSFET P-CH 60V 1.6A SOT23-3; Manufacturer: Vishay Siliconix; Item Type: MOSFETs; Rise Time: 35ns; Rds On Max: 345mR; Input Capacitance: 210pF; Continuous Drain Current (ID): 1.2A; Max Power Dissipation: 1.7W; Gate to Source Voltage (Vgs): 20V; Turn-Off Delay Time: 15ns; Turn-On Delay Time: 40ns; Number of Channels: 1; Polarity: P-CHANNEL; Power Dissipation: 1W; Threshold Voltage: -1V; Supplier: Mouser; LCSC Part Number: C553975; Manufacturer Part Number: SI2309CDS-T1-E3; RoHS: Yes; Stock: 57582; Pricing: 1=0.53, 10=0.453, 50=0.453, 100=0.316, 1000=0.2, 10000=0.157 (USD); Mounting Technology: Surface Mount; Case/Package: SOT-23-3; Pins: 3; Weight: 0.050717oz; Min Operating Temperature: -55°C; Max Operating Temperature: 150°C; Packaging: Tape and Reel; Package Quantity: 3000; Drain to Source Voltage (Vdss): 60V; Drain to Source Resistance: 345mR; Fall Time: 35ns; Series: TrenchFET®; Drain-source On Resistance-Max: 345mR; Length: 3.04mm; Width: 1.4mm; Height: 1.02mm; Radiation Hardening: No; Lead Free: Lead Free; RoHS Compliant: Yes; ComponentLink1URL: https://datasheet.ciiva.com/16217/si2309cd-16217597.pdf?src-supplier=Future+Electronics; ComponentLink1Description: https://datasheet.ciiva.com/16217/si2309cd-16217597.pdf?src-supplier=Future+Electronics; ComponentLink2URL: https://datasheet.ciiva.com/29742/si2309cd-29742879.pdf?src-supplier=Digikey; ComponentLink2Description: https://datasheet.ciiva.com/29742/si2309cd-29742879.pdf?src-supplier=Digikey
Q4 = MMBT4401-7-F: TRANS NPN 40V 0.6A SOT23-3; Manufacturer: Diodes; Item Type: BJTs; Supplier: Future Electronics; LCSC Part Number: C151826; Manufacturer Part Number: MMBT4401-7-F; RoHS: Yes; Stock: 1359000; Pricing: 3000=0.0119, 12000=0.0113, 30000=0.011, 75000=0.0107, 120000=0.0102 (USD); ComponentLink1URL: https://datasheet.ciiva.com/15139/getdatasheetpartid-91436-15139165.pdf?src-supplier=Verical; ComponentLink1Description: https://datasheet.ciiva.com/15139/getdatasheetpartid-91436-15139165.pdf?src-supplier=Verical; ComponentLink2URL: https://datasheet.ciiva.com/972/ds30039-972547.pdf?src-supplier=Digikey; ComponentLink2Description: https://datasheet.ciiva.com/972/ds30039-972547.pdf?src-supplier=Digikey; ComponentLink3URL: https://datasheet.ciiva.com/972/ds30039-972548.pdf?src-supplier=Digikey; ComponentLink3Description: https://datasheet.ciiva.com/972/ds30039-972548.pdf?src-supplier=Digikey; ComponentLink4URL: https://datasheet.ciiva.com/972/ds30039-972549.pdf?src-supplier=Digikey; ComponentLink4Description: https://datasheet.ciiva.com/972/ds30039-972549.pdf?src-supplier=Digikey; ComponentLink5URL: https://datasheet.ciiva.com/11201/ds30039-11201820.pdf?src-supplier=Avnet; ComponentLink5Description: https://datasheet.ciiva.com/11201/ds30039-11201820.pdf?src-supplier=Avnet; ComponentLink6URL: https://datasheet.ciiva.com/16199/ds30039-16199054.pdf?src-supplier=Future+Electronics; ComponentLink6Description: https://datasheet.ciiva.com/16199/ds30039-16199054.pdf?src-supplier=Future+Electronics
R1 R4 = RC1206FR-073M09L: RES 3.09M OHM 1% 1/4W 1206; Manufacturer: Yageo; Item Type: Resistor; Temperature Coefficient: 100ppm/°C; Max Power Dissipation: 250mW; Voltage Rating (DC): 200V; Supplier: Mouser; LCSC Part Number: C488771; Manufacturer Part Number: RC1206FR-073M09L; RoHS: Yes; Stock: 10394; Pricing: 1=0.1, 10=0.025, 50=0.025, 100=0.015, 1000=0.013, 10000=0.01 (USD); Case/Package: 1206; Contact Plating: Tin,Matte; Case Code (Metric): 3216; Case Code (Imperial): 1206; Min Operating Temperature: -55°C; Max Operating Temperature: 155°C; Value: 3.09MR; Tolerance: 1%; Package Quantity: 1; Packaging: Cut Tape; Number of Terminations: 2; Features: Moisture Resistant; Series: RC; Length: 0.122inch; Width: 0.063inch; Height: 0.026inch; Lead Free: Lead Free; RoHS Compliant: Yes; ComponentLink1URL: https://datasheet.ciiva.com/2461/pyu-rc1206-51-rohs-l-4-2461290.pdf?src-supplier=Digikey; ComponentLink1Description: https://datasheet.ciiva.com/2461/pyu-rc1206-51-rohs-l-4-2461290.pdf?src-supplier=Digikey; ComponentLink2URL: https://datasheet.ciiva.com/2461/pyu-rc1206-51-rohs-l-4-2461291.pdf?src-supplier=Digikey; ComponentLink2Description: https://datasheet.ciiva.com/2461/pyu-rc1206-51-rohs-l-4-2461291.pdf?src-supplier=Digikey; ComponentLink3URL: https://datasheet.ciiva.com/2461/pyu-rc1206-51-rohs-l-4-2461292.pdf?src-supplier=Digikey; ComponentLink3Description: https://datasheet.ciiva.com/2461/pyu-rc1206-51-rohs-l-4-2461292.pdf?src-supplier=Digikey
R2 R23 = CRCW080510R0FKEAHP: RES SMD 10 OHM 1% 1/2W 0805; Manufacturer: Vishay; Item Type: Resistor; Power Rating: 330mW; Voltage Rating: 150V; Temperature Coefficient: 100ppm/°C; Max Power Dissipation: 333mW; Supplier: Mouser; LCSC Part Number: C844598; Manufacturer Part Number: CRCW080510R0FKEAHP; RoHS: Yes; Stock: 384044; Pricing: 1=0.19, 10=0.066, 50=0.066, 100=0.04, 1000=0.027, 10000=0.023 (USD); Case/Package: 0805; Weight: 0.000194oz; Case Code (Imperial): 0805; Case Code (Metric): 2012; Contact Plating: Tin; Min Operating Temperature: -55°C; Max Operating Temperature: 155°C; Value: 10R; Tolerance: 1%; Packaging: Tape and Reel; Package Quantity: 5000; Resistor Type: Thick Film; Termination: SMD/SMT; Voltage Rating (DC): 150V; Features: Automotive AEC-Q200; Series: CRCW-HP; Number of Terminations: 2; Resistance Tolerance: 1%; Technology: THICK FILM; Construction: Rectangular; Length: 2mm; Width: 1.2mm; Height: 0.5mm; Depth: 1.25mm; Ratings: AEC-Q200; Radiation Hardening: No; Military Standard: Not; Lead Free: Lead Free; RoHS Compliant: Yes; Reach SVHC Compliant: Unknown; ComponentLink1URL: http://www.farnell.com/datasheets/2884039.pdf?src-supplier=Newark; ComponentLink1Description: http://www.farnell.com/datasheets/2884039.pdf?src-supplier=Newark; ComponentLink2URL: https://datasheet.octopart.com/CRCW080510R0FKEAHP-Vishay-datasheet-87136057.pdf?src-supplier=Newark; ComponentLink2Description: https://datasheet.octopart.com/CRCW080510R0FKEAHP-Vishay-datasheet-87136057.pdf?src-supplier=Newark; ComponentLink3URL: http://www.vishay.com/docs/20043/crcwhpe3.pdf?src-supplier=Digikey; ComponentLink3Description: http://www.vishay.com/docs/20043/crcwhpe3.pdf?src-supplier=Digikey
R3 R7 R8 R11 = RC1206FR-073M3L: RES 3.3M OHM 1% 1/4W 1206; Manufacturer: Yageo; Item Type: Resistor; Voltage Rating (AC): 200V; Supplier: Future Electronics; LCSC Part Number: C137288; Manufacturer Part Number: RC1206FR-073M3L; RoHS: Yes; Stock: 130000; Pricing: 5000=0.0038, 20000=0.0036, 75000=0.0034, 200000=0.0032, 500000=0.003 (USD); ComponentLink1URL: https://datasheet.ciiva.com/11809/0900766b80c6630a-11809505.pdf?src-supplier=Rs; ComponentLink1Description: https://datasheet.ciiva.com/11809/0900766b80c6630a-11809505.pdf?src-supplier=Rs; ComponentLink2URL: https://datasheet.ciiva.com/2511/pyu-rc1206-51-rohs-l-4-2511094.pdf?src-supplier=Digikey; ComponentLink2Description: https://datasheet.ciiva.com/2511/pyu-rc1206-51-rohs-l-4-2511094.pdf?src-supplier=Digikey; ComponentLink3URL: https://datasheet.ciiva.com/2511/pyu-rc1206-51-rohs-l-4-2511095.pdf?src-supplier=Digikey; ComponentLink3Description: https://datasheet.ciiva.com/2511/pyu-rc1206-51-rohs-l-4-2511095.pdf?src-supplier=Digikey; ComponentLink4URL: https://datasheet.ciiva.com/2511/pyu-rc1206-51-rohs-l-4-2511096.pdf?src-supplier=Digikey; ComponentLink4Description: https://datasheet.ciiva.com/2511/pyu-rc1206-51-rohs-l-4-2511096.pdf?src-supplier=Digikey; ComponentLink5URL: https://datasheet.ciiva.com/17420/pyu-rc1206-51-rohs-l-4-17420140.pdf?src-supplier=Future+Electronics; ComponentLink5Description: https://datasheet.ciiva.com/17420/pyu-rc1206-51-rohs-l-4-17420140.pdf?src-supplier=Future+Electronics
R5 = CRCW06031R00FKEA: RES SMD 1 OHM 1% 1/10W 0603; Manufacturer: Vishay Dale; Item Type: Resistor; Power Rating: 100mW; Voltage Rating: 75V; Temperature Coefficient: 100ppm/°C; Supplier: Mouser; LCSC Part Number: C844752; Manufacturer Part Number: CRCW06031R00FKEA; RoHS: Yes; Stock: 303523; Pricing: 1=0.1, 10=0.024, 50=0.024, 100=0.014, 1000=0.011, 10000=0.006 (USD); Case/Package: 0603; Pins: 2; Contact Plating: Tin; Weight: 7.1E-05oz; Case Code (Metric): 1608; Case Code (Imperial): 0603; Min Operating Temperature: -55°C; Max Operating Temperature: 155°C; Value: 1R; Tolerance: 1%; Resistor Type: Thick Film; Termination: SMD/SMT; Voltage Rating (DC): 75V; Packaging: Tape and Reel; Number of Terminations: 2; Max Power Dissipation: 100mW; Features: Automotive AEC-Q200; Series: CRCW; Construction: Rectangular; Resistance Tolerance: 1%; Package Quantity: 5000; Length: 1.55mm; Width: 0.85mm; Height: 0.45mm; Depth: 0.85mm; Ratings: AEC-Q200; Radiation Hardening: No; Lead Free: 5697LeadFree; RoHS Compliant: Yes; Military Standard: Not; Reach SVHC Compliant: Unknown; ComponentLink1URL: https://datasheet.ciiva.com/7792/1359337-7792119.pdf?src-supplier=Element14; ComponentLink1Description: https://datasheet.ciiva.com/7792/1359337-7792119.pdf?src-supplier=Element14; ComponentLink2URL: https://datasheet.ciiva.com/3257/dcrcwe3-3257225.pdf?src-supplier=Avnet; ComponentLink2Description: https://datasheet.ciiva.com/3257/dcrcwe3-3257225.pdf?src-supplier=Avnet; ComponentLink3URL: https://datasheet.ciiva.com/2465/dcrcwe3-2465530.pdf?src-supplier=Digikey; ComponentLink3Description: https://datasheet.ciiva.com/2465/dcrcwe3-2465530.pdf?src-supplier=Digikey; ComponentLink4URL: https://datasheet.ciiva.com/2465/dcrcwe3-2465528.pdf?src-supplier=Digikey; ComponentLink4Description: https://datasheet.ciiva.com/2465/dcrcwe3-2465528.pdf?src-supplier=Digikey; ComponentLink5URL: https://datasheet.ciiva.com/5541/dcrcwe3-109170-5541726.pdf?src-supplier=Mouser; ComponentLink5Description: https://datasheet.ciiva.com/5541/dcrcwe3-109170-5541726.pdf?src-supplier=Mouser
R6 = RC0603FR-0782K5L: RES 82.5K OHM 1% 1/10W 0603; Manufacturer: Yageo; Item Type: Resistor; Voltage Rating (DC): 50V; Supplier: Avnet; LCSC Part Number: C185310; Manufacturer Part Number: RC0603FR-0782K5L; RoHS: Yes; Stock: 165000; Pricing: 5000=0.00112 (USD); Lead Free: 5697LeadFree; ComponentLink1URL: https://datasheet.ciiva.com/2519/pyu-r-int-thick-7-2519111.pdf?src-supplier=Digikey; ComponentLink1Description: https://datasheet.ciiva.com/2519/pyu-r-int-thick-7-2519111.pdf?src-supplier=Digikey; ComponentLink2URL: https://datasheet.ciiva.com/2519/pyu-r-int-thick-7-2519112.pdf?src-supplier=Digikey; ComponentLink2Description: https://datasheet.ciiva.com/2519/pyu-r-int-thick-7-2519112.pdf?src-supplier=Digikey; ComponentLink3URL: https://datasheet.ciiva.com/2519/pyu-r-int-thick-7-2519113.pdf?src-supplier=Digikey; ComponentLink3Description: https://datasheet.ciiva.com/2519/pyu-r-int-thick-7-2519113.pdf?src-supplier=Digikey
R9 = RC0603FR-071ML: RES SMD 1M OHM 1% 1/10W 0603; Manufacturer: Yageo; Voltage Rating: 50V; Resistance: 1MR; Power Rating: 100mW; Temperature Coefficient: 100ppm/°C; Item Type: Resistor; Supplier 1: Digi-Key; Manufacturer Part Number: RC0603FR-071ML; Stock 1: 3824601; Pricing 1: 1=0.1, 10=0.023, 100=0.0094, 1000=0.00421, 2500=0.00366 (USD); Case/Package: 0603; Number of Pins: 2; Case Code (Imperial): 0603; Case Code (Metric): 1608; Min Operating Temperature: -55°C; Max Operating Temperature: 155°C; Voltage Rating (DC): 50V; Tolerance: 1%; Packaging: Tape and Reel; Package Quantity: 5000; Termination: SMD/SMT; Composition: Thick Film; Military Standard: Not; Length: 1.6mm; Height: 0.45mm; Width: 0.8mm; Depth: 0.8mm; REACH SVHC: No SVHC; Lead Free: Lead Free; ComponentLink1URL: http://www.farnell.com/datasheets/2167052.pdf?src-supplier=Mouser; ComponentLink1Description: http://www.farnell.com/datasheets/2167052.pdf?src-supplier=Mouser; ComponentLink2URL: http://www.farnell.com/datasheets/2167052.pdf?src-supplier=Element14; ComponentLink2Description: http://www.farnell.com/datasheets/2167052.pdf?src-supplier=Element14; ComponentLink3URL: http://documents.rs-components.com/techlib://itc_doclist_GB.htm?stockno=5048956&src-supplier=RSComponents; ComponentLink3Description: http://documents.rs-components.com/techlib://itc_doclist_GB.htm?stockno=5048956&src-supplier=RSComponents; Supplier Part Number 1: 311-1.00MHRDKR-ND; LCSC Part Number: C105578
R10 = RC0603FR-0724K3L: RES 24.3K OHM 1% 1/10W 0603; Manufacturer: Yageo; Item Type: Resistors; Voltage Rating (DC): 50V; Supplier: Future Electronics; Supplier Part Number: 6938161; Manufacturer Part Number: RC0603FR-0724K3L; RoHS: Yes; Stock: 440000; Pricing: 5000=0.0015, 50000=0.0014, 150000=0.0014, 375000=0.0013, 1000000=0.0012 (USD); Lead Free: 5697LeadFree; ComponentLink1URL: https://datasheet.ciiva.com/15189/getdatasheetpartid-326710-15189669.pdf?src-supplier=Verical; ComponentLink1Description: https://datasheet.ciiva.com/15189/getdatasheetpartid-326710-15189669.pdf?src-supplier=Verical